# Altium schematic sheet S7_CRSF_IBUS_SBUS_DSM_Ports.SchDoc
size 420 x 297 mm; SheetNumber: 9; SheetTotal: 9
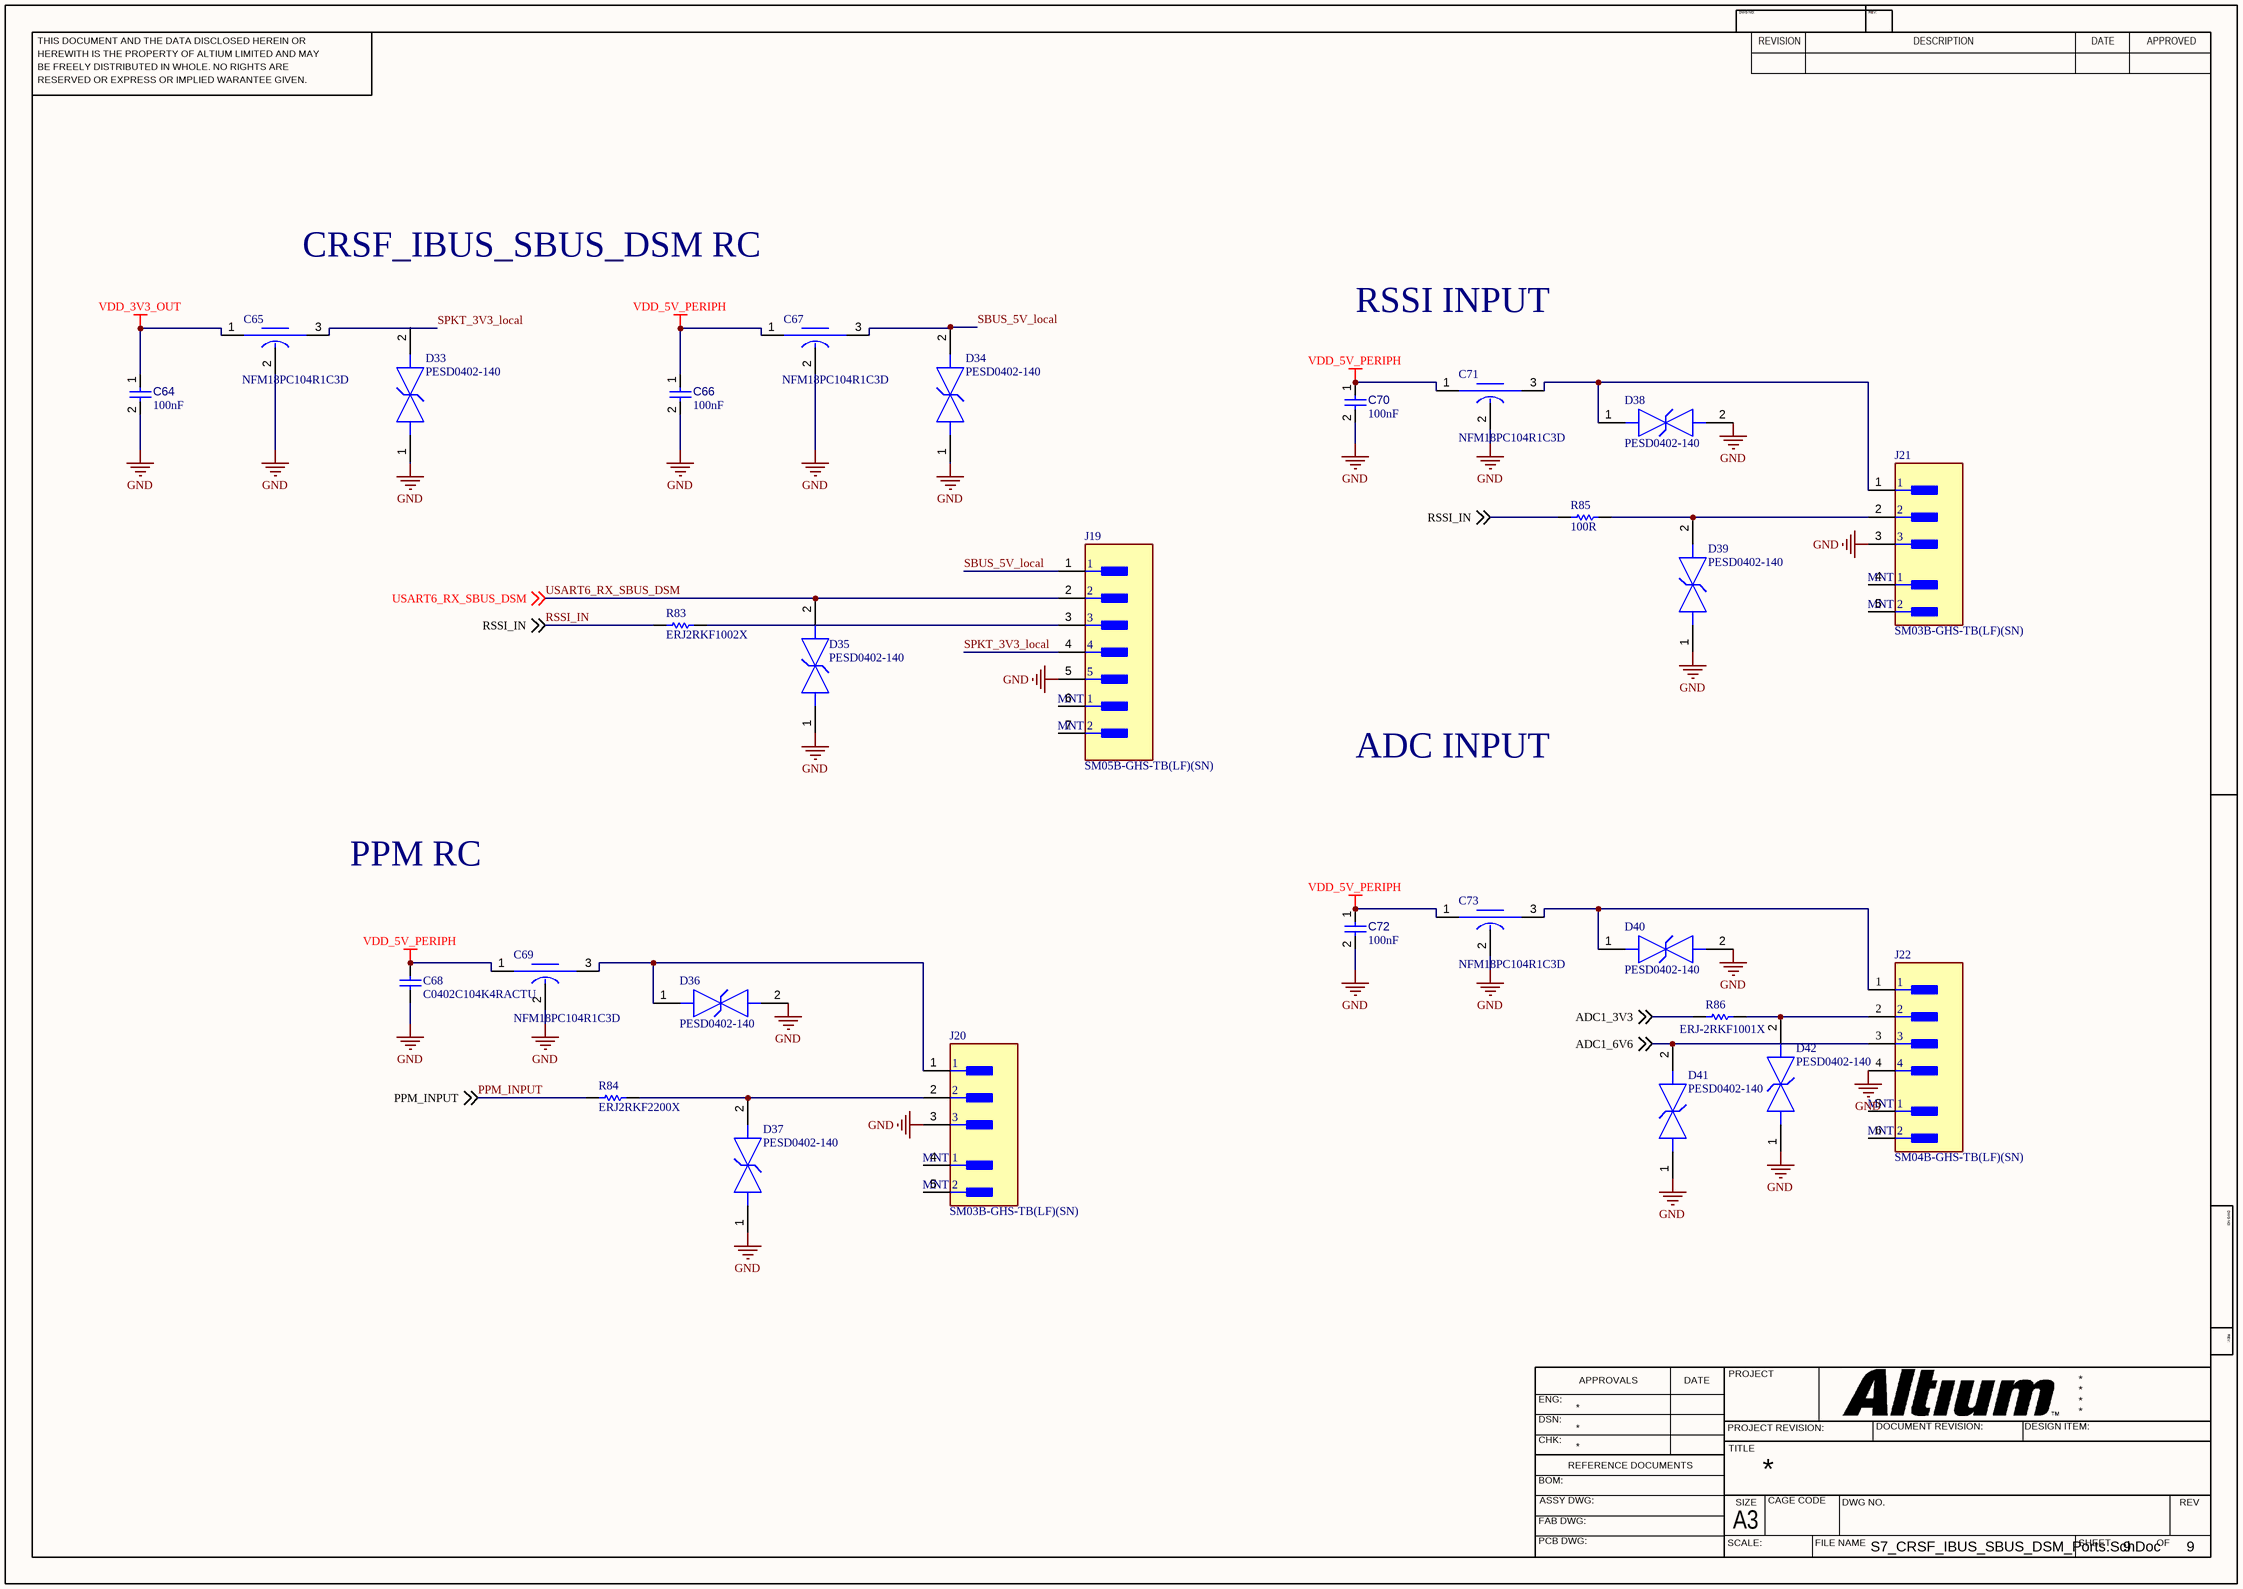
[diagram p0: S7_CRSF_IBUS_SBUS_DSM_Ports.SchDoc]

## Parts
C64  value 100nF  [CAPC0402(1005)60_L]  (hidden comment: Capacitor 100nF +/-20% 25V 0402)
C65  NFM18PC104R1C3D  [FP-NFM18-0_1-e0_15_0_35-MFG]
C66  value 100nF  [CAPC0402(1005)60_L]  (hidden comment: Capacitor 100nF +/-20% 25V 0402)
C67  NFM18PC104R1C3D  [FP-NFM18-0_1-e0_15_0_35-MFG]
C68  C0402C104K4RACTU  [CAPC1005X55X30LL05T10]
C69  NFM18PC104R1C3D  [FP-NFM18-0_1-e0_15_0_35-MFG]
C70  value 100nF  [CAPC0402(1005)60_L]  (hidden comment: Capacitor 100nF +/-20% 25V 0402)
C71  NFM18PC104R1C3D  [FP-NFM18-0_1-e0_15_0_35-MFG]
C72  value 100nF  [CAPC0402(1005)60_L]  (hidden comment: Capacitor 100nF +/-20% 25V 0402)
C73  NFM18PC104R1C3D  [FP-NFM18-0_1-e0_15_0_35-MFG]
D33  PESD0402-140  [FP-PESD0402-MFG]
D34  PESD0402-140  [FP-PESD0402-MFG]
D35  PESD0402-140  [FP-PESD0402-MFG]
D36  PESD0402-140  [FP-PESD0402-MFG]
D37  PESD0402-140  [FP-PESD0402-MFG]
D38  PESD0402-140  [FP-PESD0402-MFG]
D39  PESD0402-140  [FP-PESD0402-MFG]
D40  PESD0402-140  [FP-PESD0402-MFG]
D41  PESD0402-140  [FP-PESD0402-MFG]
D42  PESD0402-140  [FP-PESD0402-MFG]
J19  SM05B-GHS-TB(LF)(SN)  [FP-SM05B-GHS-TB_LF_SN-MFG]
J20  SM03B-GHS-TB(LF)(SN)  [FP-SM03B-GHS-TB_LF_SN-MFG]
J21  SM03B-GHS-TB(LF)(SN)  [FP-SM03B-GHS-TB_LF_SN-MFG]
J22  SM04B-GHS-TB(LF)(SN)  [FP-SM04B-GHS-TB_LF_SN-MFG]
R83  ERJ2RKF1002X  [RESC1005X40X25LL05T05]
R84  ERJ2RKF2200X  [RESC1005X40X25LL05T05]
R85  100R  [RESC1005X40X25LL05T10]
R86  ERJ-2RKF1001X  [RESC1005X40X25NL05T05]

## Nets
GND: C64.2 C65.2(GND) C66.2 C67.2(GND) C68.1 C69.2(GND) C70.2 C71.2(GND) C72.2 C73.2(GND) D33.1 D34.1 D35.1 D36.2 D37.1 D38.2 D39.1 D40.2 D41.1 D42.1 J19.5 J20.3 J21.3 J22.4
VDD_3V3_OUT: C64.1 C65.1(Input)
VDD_5V_PERIPH: C66.1 C67.1(Input) C68.2 C69.1(Input) C70.1 C71.1(Input) C72.1 C73.1(Input)
ADC1_3V3: R86.2 ; off-sheet ADC1_3V3
ADC1_6V6: D41.2 J22.3 ; off-sheet ADC1_6V6
PPM_INPUT: R84.1 ; off-sheet PPM_INPUT
RSSI_IN: R83.1 R85.1 ; off-sheet RSSI_IN
SBUS_5V_local: C67.3(Output) D34.2 J19.1
SPKT_3V3_local: C65.3(Output) J19.4
USART6_RX_SBUS_DSM: D35.2 J19.2 ; off-sheet USART6_RX_SBUS_DSM
NetC69_3: C69.3(Output) D36.1 J20.1
NetC71_3: C71.3(Output) D38.1 J21.1
NetC73_3: C73.3(Output) D40.1 J22.1
NetD37_2: D37.2 J20.2 R84.2
NetD39_2: D39.2 J21.2 R85.2
NetD42_2: D42.2 J22.2 R86.1
NetJ19_3: J19.3 R83.2

Not connected (* = marked no-connect by the designer): D33 2; J19 6(MNT_1) 7(MNT_2); J20 4(MNT_1) 5(MNT_2); J21 4(MNT_1) 5(MNT_2); J22 5(MNT_1) 6(MNT_2)

## Notes on the sheet
- CRSF_IBUS_SBUS_DSM RC
- RSSI INPUT
- ADC INPUT
- PPM RC
- THIS DOCUMENT AND THE DATA DISCLOSED HEREIN OR
- HEREWITH IS THE PROPERTY OF ALTIUM LIMITED AND MAY
- DWG NO:
- REVISION
- REV:
- DESCRIPTION
- DATE
- APPROVED
- BE FREELY DISTRIBUTED IN WHOLE. NO RIGHTS ARE
- RESERVED OR EXPRESS OR IMPLIED WARANTEE GIVEN.
- ENG:
- APPROVALS
- PROJECT
- DSN:
- CHK:
- REFERENCE DOCUMENTS
- PROJECT REVISION:
- TITLE
- DOCUMENT REVISION:
- DESIGN ITEM:
- BOM:
- FAB DWG:
- PCB DWG:
- ASSY DWG:
- SCALE:
- A3
- SIZE
- CAGE CODE
- FILE NAME
- DWG NO.
- SHEET
- OF
- REV

## Library data of the parts
C64 C66 C70 C72 = CMP-001-00065-4: Chip Capacitor, 100nF +/-20%, 25V, 0402, Thickness 0.6 mm; Tolerance: 10%; Max Operating Temperature: 85°C; Min Operating Temperature: -55°C; Pins: 2; Voltage Rating: 25V; Mounting Technology: SMT; Case/Package: 0402
C65 C67 C69 C71 C73 = CMP-06053-000054-1: Large Current 3 Terminals Low ESL Chip Multilayer Ceramic Capacitors for General Purpose, 0603, 0.10uF, 20%, 16V; Capacitance: 100nF; Insulation Resistance: 1GR; Current Rating: 2A; DC Resistance (DCR): 30mR; Case Code (Imperial): 0603; REACH SVHC: No SVHC; Width: 0.8mm; Case Code (Metric): 1608; Voltage Rating (DC): 16V; Case/Package: 0603; Packaging: Tape and Reel; Length: 1.6mm; Height: 0.6mm; Voltage: 16V; Depth: 0.8mm; Radiation Hardening: No; Max Operating Temperature: 125°C; Max Voltage Rating (DC): 16V; Voltage Rating: 16V; Max Current Rating: 2A; Tolerance: 20%; Min Operating Temperature: -55°C; Mount: PCB; Termination: Flat; Current: 2A; Package Quantity: 4000; Lead Free: Lead Free
C68 = CMP-0001-00074-2: Manufacturer: Kemet; Part Number: C0402C104K4RACTU
D33-D42 = CMP-08607-000011-1: TVS DIODE 14V 40V 0402; Manufacturer: Littelfuse Inc.; Automotive Grade: Grade 1; Capacitance: 0.25pF; Value: 0.25pF; Direction: Bidirectional; Number Of Channels: 1; Temperature Range Low: -55°C; Lead Free: Yes; Temperature: -55°C to +125°C; Digikey Description: TVS DIODE 14V 40V 0402; Automotive: Yes; Device Class L2: TVS Diodes; Reverse Standoff Voltage: 14V; Device Class L1: Circuit Protection; Ipc Land Pattern Name: DIOC10050X33; Manufacturer Part Number: PESD0402-140; Breakdown Voltage: 14V; Height: 0.43mm; Clamping Voltage: 40V; RoHS: TRUE; Temperature Range High: +125°C; Device Class L3: unset; Octopart: https://octopart.com/pesd0402-140-littelfuse-74215061; Package: PESD0402; ComponentLink2URL: https://www.littelfuse.com/~/media/electronics/datasheets/polymer_esd_suppressors/littelfuse_polymer_esd_suppressor_pesd_catalog_datasheet.pdf.pdf; Category: Diode; ComponentLink2Description: Datasheet
J19 = CMP-17439-000048-1: CONN HEADER SMD R/A 5POS 1.25MM; Current Rating: 1A; Pitch: 0.049inch; Connector Type: Outer Shroud Contact; Number of Positions: 5; Voltage Rating (AC): 50V; Wire/Cable Gauge: 26AWG; Series: GH; Mount: Surface Mount; Housing Material: Nylon; Contact Type: Outer Shroud Contact; REACH SVHC: No SVHC; Number of Rows: 1; Lead Free: Lead Free; Color: Natural; Contact Material: Bronze; Contact Plating: Tin; Max Operating Temperature: 85°C; Orientation: Right Angle; Number of Contacts: 5; Voltage Rating: 50V; Housing Color: Natural; Termination: Solder; Min Operating Temperature: -25°C; Fastening Type: Ramp; Packaging: Tape and Reel
J20 J21 = CMP-17439-000068-1: CONN HEADER SMD R/A 3POS 1.25MM; Voltage Rating: 50V; Wire/Cable Gauge: 26AWG; Pitch: 0.049inch; Gender: Male; Number of Positions: 3; Current Rating: 1A; Orientation: Right Angle; REACH SVHC: No SVHC; Insulation Color: Natural; Housing Material: Nylon; Mount: Surface Mount; Flammability Rating: UL94 V-0; Color: Natural; Number of Rows: 1; Housing Color: Natural; Termination: Solder; Voltage Rating (AC): 50V; Max Operating Temperature: 85°C; Connector Type: Header; Series: GH; Packaging: Tape and Reel; Contact Finish - Mating: TIN; Lead Free: Lead Free; Fastening Type: Ramp; Contact Plating: Tin; Contact Material: Bronze; Insulation Material: Nylon; Contact Type: Outer Shroud Contact; Number of Contacts: 3; Min Operating Temperature: -25°C; Contact Shape: Rectangular
J22 = CMP-17439-000411-1: CONN HEADER SMD R/A 4POS 1.25MM; Voltage Rating: 50V; Number of Contacts: 4; Current Rating: 1A; Termination: Solder; Mount: Surface Mount; REACH SVHC: No SVHC; Packaging: Cut Tape; Contact Material: Bronze; Series: GH; Orientation: Right Angle; Lead Free: Lead Free; Housing Material: Nylon; Contact Plating: Tin; Housing Color: Natural; Number of Rows: 1; Pitch: 1.25mm; Number of Positions: 4
R83 = CMP-2000-07588-1: Chip Resistor, 10 KOhm, +/- 1%, 0.1 W, -55 to 155 degC, 0402 (1005 Metric), RoHS, Tape and Reel; Manufacturer: Panasonic; Power Rating: 100mW; Voltage Rating: 50V; Resistance: 10KOhm; Case\/Package: 0402; Temperature Coefficient: 100ppm\/degreesC; RoHSCompliant: True; Lead Free: LeadFree; Package Quantity: 1; Contact Plating: Tin; Length: 1mm; Radiation Hardening: No; REACH SVHC: NoSVHC; Max Operating Temperature: 155degC; Depth: 0.5mm; Case Code (Imperial): 0402; Military Standard: Not; Package Description: 2-Pin Surface Mount Device, Body 1 x 0.5 mm; Termination: SMD/SMT; Case Code (Metric): 1005; Height: 0.35mm; Packaging: TapeandReel; Voltage Rating (DC): 50V; Package Reference: 402; Number of Pins: 2; Tolerance: 1%; Mounting Technology: SurfaceMount; Width: 0.02inch; Mount: SurfaceMount; Datasheet URL: https://industrial.panasonic.com/cdbs/www-data/pdf/RDA0000/AOA0000C304.pdf; Composition: ThickFilm; Datasheet Version: 02/2017; Manufacturer URL: http://www.panasonic.com/; Max Power Dissipation: 100mW; Number of Terminations: 2; Min Operating Temperature: -55degC
R84 = CMP-2002-01131-1: Manufacturer: Panasonic; Part Number: ERJ2RKF2200X
R85 = CMP-2002-03042-1: Manufacturer: Vishay Dale; Part Number: CRCW0402100RFKEDHP
R86 = CMP-1011-00510-4: Chip Resistor, 1 KOhm, +/- 1%, 100 mW, -55 to 155 degC, 0402 (1005 Metric), RoHS, Tape and Reel; Manufacturer: Basic Passives; Voltage Rating: 50 V; Case\/Package: 0402; Resistance: 1 KOhm; Power Rating: 100 mW; PartNumber: ERJ-2RKF1001X; DatasheetVersion: 04/2015; Radiation Hardening: No; Pins: 2; Height: 0.35 mm; RoHSCompliant: true; Case Code (Imperial): 0402; ComponentLink2Description: Datasheet; ComponentLink1Description: Manufacturer URL; PackageReference: 0402; Mount: Surface Mount; Package Quantity: 10000; Tolerance: 1%; ComponentLink1URL: http://www.panasonic.com/; PackageDescription: 2-Pin Surface Mount Device, Body 1 x 0.5 mm; Mounting Technology: Surface Mount; Case Code (Metric): 1005; ComponentLink2URL: http://industrial.panasonic.com/cdbs/www-data/pdf/RDA0000/AOA0000C86.pdf; REACH SVHC: Yes; Packaging: Tape and Reel; Max Operating Temperature: 155 degC; Min Operating Temperature: -55 degC; Width: 0.5 mm; Length: 1 mm